# Altium schematic sheet MotorDriverChannel.SchDoc
size A4; SheetNumber: 2; SheetTotal: 5
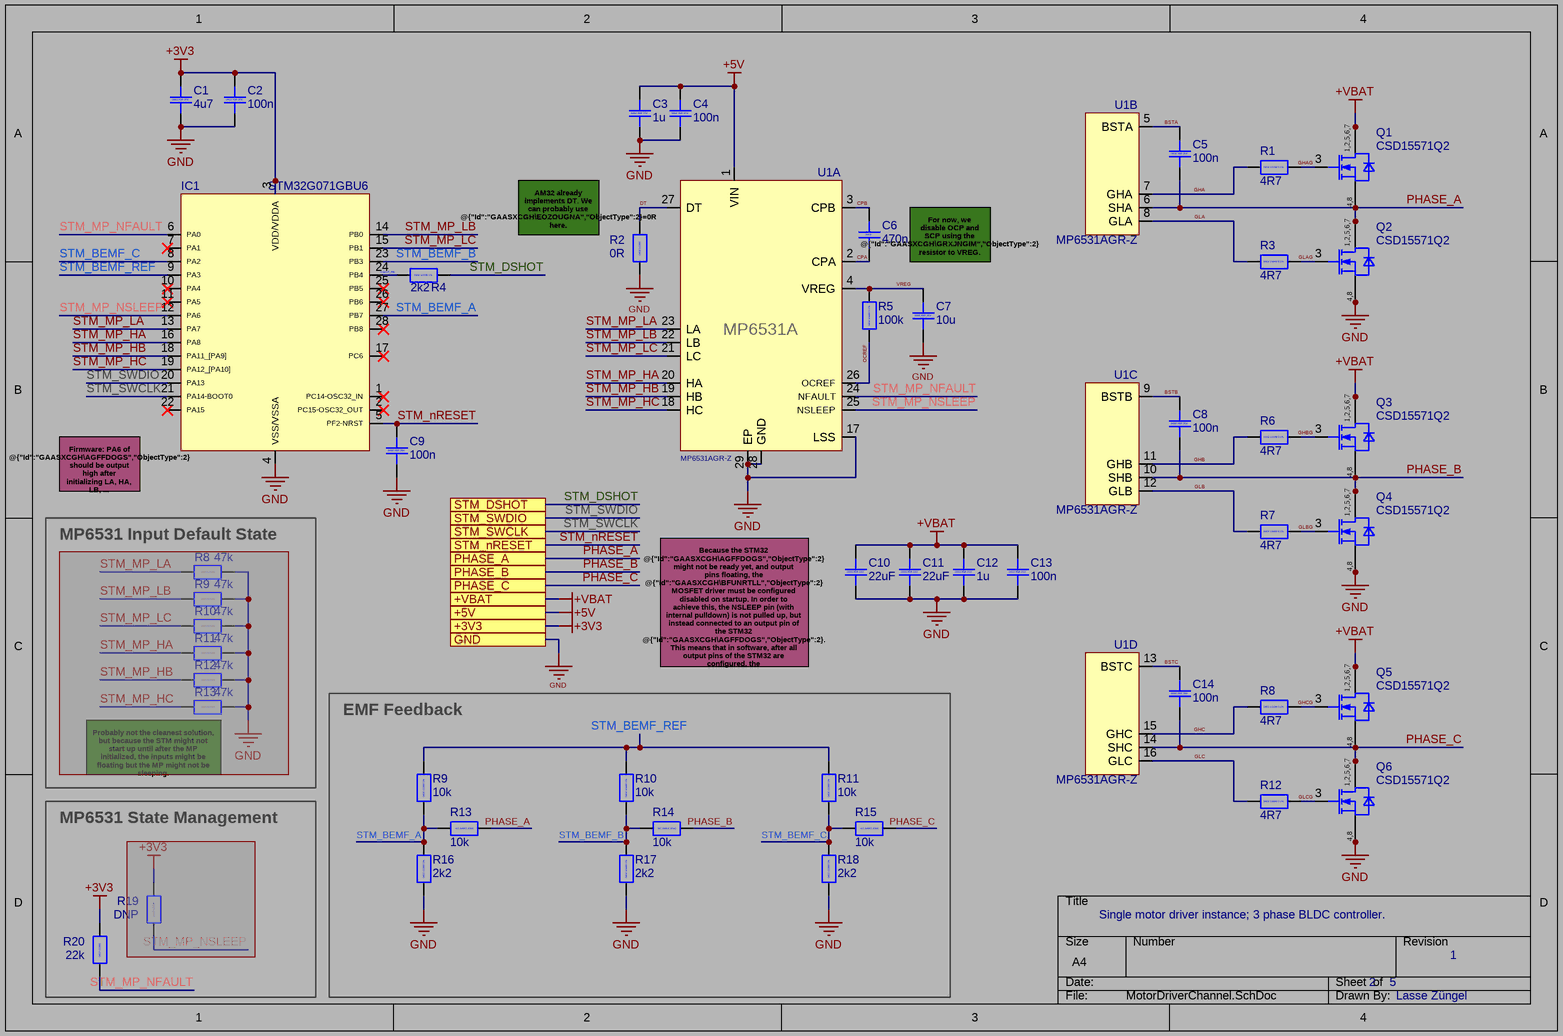
[diagram p0: MotorDriverChannel.SchDoc]

## Parts
(Parts that share a designator on the sheet are numbered #1, #2 ... from top to bottom, then left to right.)
C1  4u7  [CAP_0603_L]
C2  100n  [CAP_0402]
C3  1u  [CAP_0402]
C4  100n  [CAP_0402]
C5  100n  [CAP_0402]
C6  470n  [CAP_0402]
C7  10u  [CAP_0805s]
C8  100n  [CAP_0402]
C9  100n  [CAP_0402]
C10  22uF  [CAP_0805s]
C11  22uF  [CAP_0805s]
C12  1u  [CAP_0603_L]
C13  100n  [CAP_0402]
C14  100n  [CAP_0402]
IC1  STM32G071GBU6  [UFQFN28-STM32]
Q1  CSD15571Q2  [CSD15571Q2]
Q2  CSD15571Q2  [CSD15571Q2]
Q3  CSD15571Q2  [CSD15571Q2]
Q4  CSD15571Q2  [CSD15571Q2]
Q5  CSD15571Q2  [CSD15571Q2]
Q6  CSD15571Q2  [CSD15571Q2]
R1  4R7  [RES_0402]
R2  0R  [RES_0402]
R3  4R7  [RES_0402]
R4  2k2  [RES_0402]
R5  100k  [RES_0402]
R6  4R7  [RES_0402]
R7  4R7  [RES_0402]
R8#1  47k  [RES_0402]  (masked out: inside a compile mask, not in the netlist)
R8#2  4R7  [RES_0402]
R9#1  47k  [RES_0402]  (masked out: inside a compile mask, not in the netlist)
R9#2  10k  [RES_0402]
R10#1  47k  [RES_0402]  (masked out: inside a compile mask, not in the netlist)
R10#2  10k  [RES_0402]
R11#1  47k  [RES_0402]  (masked out: inside a compile mask, not in the netlist)
R11#2  10k  [RES_0402]
R12#1  47k  [RES_0402]  (masked out: inside a compile mask, not in the netlist)
R12#2  4R7  [RES_0402]
R13#1  47k  [RES_0402]  (masked out: inside a compile mask, not in the netlist)
R13#2  10k  [RES_0402]
R14  10k  [RES_0402]
R15  10k  [RES_0402]
R16  2k2  [RES_0402]
R17  2k2  [RES_0402]
R18  2k2  [RES_0402]
R19  DNP  [RES_0402]  (masked out: inside a compile mask, not in the netlist)
R20  22k  [RES_0402]
U1  MP6531AGR-Z  [MP6531A-QFN40P400X400X100-29N]  (parts A,B,C,D of 4)

## Blocks framed on the sheet
MP6531 Input Default State: R8#1 R9#1 R10#1 R11#1 R12#1 R13#1
EMF Feedback: R9#2 R10#2 R11#2 R13#2 R14-R18
MP6531 State Management: R19 R20

## Ports
+3V3 (see Main[2B], Interfacing[1A], Power[1B]), +5V (see Main[2B], Interfacing[1A], Power[1B]), +VBAT (see Main[2B], Interfacing[2B], Power[1B]), GND (see Main[2C], Interfacing[1A], Power[1B]), PHASE_A (see Main[2C], MotorConnection[1A]), PHASE_B (see Main[2C], MotorConnection[1A]), PHASE_C (see Main[2C], MotorConnection[1A]), STM_DSHOT (see Main[2C]), STM_nRESET (see Main[2C]), STM_SWCLK (see Main[2C]), STM_SWDIO (see Main[2C])

## Nets
+3V3: C1.2 C2.2 IC1.3(VDD/VDDA) R20.2 ; port +3V3
+5V: C3.2 C4.2 U1.1(VIN) ; port +5V
+VBAT: C10.2 C11.2 C12.2 C13.2 Q1.1(D_1) Q1.2(D_2) Q1.5(D_3) Q1.6(D_4) Q1.7(D_5) Q3.1(D_1) Q3.2(D_2) Q3.5(D_3) Q3.6(D_4) Q3.7(D_5) Q5.1(D_1) Q5.2(D_2) Q5.5(D_3) Q5.6(D_4) Q5.7(D_5) ; port +VBAT
GND: C1.1 C2.1 C3.1 C4.1 C7.1 C9.1 C10.1 C11.1 C12.1 C13.1 IC1.4(VSS/VSSA) Q2.4(S_1) Q2.8(S_2) Q4.4(S_1) Q4.8(S_2) Q6.4(S_1) Q6.8(S_2) R2.1 R16.1 R17.1 R18.1 U1.17(LSS) U1.28(GND) U1.29(EP) ; port GND
BSTA: C5.2 U1.5(BSTA)
BSTB: C8.2 U1.9(BSTB)
BSTC: C14.2 U1.13(BSTC)
CPA: C6.1 U1.2(CPA)
CPB: C6.2 U1.3(CPB)
DSHOT_PIN: IC1.24(PB4) R4.1
DT: R2.2 U1.27(DT)
GHA: R1.1 U1.7(GHA)
GHAG: Q1.3(G) R1.2
GHB: R6.1 U1.11(GHB)
GHBG: Q3.3(G) R6.2
GHC: R8#2.1 U1.15(GHC)
GHCG: Q5.3(G) R8#2.2
GLA: R3.1 U1.8(GLA)
GLAG: Q2.3(G) R3.2
GLB: R7.1 U1.12(GLB)
GLBG: Q4.3(G) R7.2
GLC: R12#2.1 U1.16(GLC)
GLCG: Q6.3(G) R12#2.2
OCREF: R5.1 U1.26(OCREF)
PHASE_A: C5.1 Q1.4(S_1) Q1.8(S_2) Q2.1(D_1) Q2.2(D_2) Q2.5(D_3) Q2.6(D_4) Q2.7(D_5) R13#2.1 U1.6(SHA) ; port PHASE_A
PHASE_B: C8.1 Q3.4(S_1) Q3.8(S_2) Q4.1(D_1) Q4.2(D_2) Q4.5(D_3) Q4.6(D_4) Q4.7(D_5) R14.1 U1.10(SHB) ; port PHASE_B
PHASE_C: C14.1 Q5.4(S_1) Q5.8(S_2) Q6.1(D_1) Q6.2(D_2) Q6.5(D_3) Q6.6(D_4) Q6.7(D_5) R15.1 U1.14(SHC) ; port PHASE_C
STM_BEMF_A: IC1.27(PB7) R9#2.1 R13#2.2 R16.2
STM_BEMF_B: IC1.23(PB3) R10#2.1 R14.2 R17.2
STM_BEMF_C: IC1.8(PA2) R11#2.1 R15.2 R18.2
STM_BEMF_REF: IC1.9(PA3) R9#2.2 R10#2.2 R11#2.2
STM_DSHOT: R4.2 ; port STM_DSHOT
STM_MP_HA: IC1.16(PA8) U1.20(HA)
STM_MP_HB: IC1.18(PA11_[PA9]) U1.19(HB)
STM_MP_HC: IC1.19(PA12_[PA10]) U1.18(HC)
STM_MP_LA: IC1.13(PA7) U1.23(LA)
STM_MP_LB: IC1.14(PB0) U1.22(LB)
STM_MP_LC: IC1.15(PB1) U1.21(LC)
STM_MP_NFAULT: IC1.6(PA0) R20.1 U1.24(NFAULT)
STM_MP_NSLEEP: IC1.12(PA6) U1.25(NSLEEP)
STM_nRESET: C9.2 IC1.5(PF2-NRST) ; port STM_nRESET
STM_SWCLK: IC1.21(PA14-BOOT0) ; port STM_SWCLK
STM_SWDIO: IC1.20(PA13) ; port STM_SWDIO
VREG: C7.2 R5.2 U1.4(VREG)

Not connected (* = marked no-connect by the designer): IC1 1(PC14-OSC32_IN)* 2(PC15-OSC32_OUT)* 7(PA1)* 10(PA4)* 11(PA5)* 17(PC6)* 22(PA15)* 25(PB5)* 26(PB6)* 28(PB8)*

## Notes on the sheet
- (near R2) AM32 already implements DT. We can probably use @{"Id":"GAASXCGH\EOZOUGNA","ObjectType":2}=0R here.
- For now, we disable OCP and SCP using the @{"Id":"GAASXCGH\GRXJNGIM","ObjectType":2} resistor to VREG.
- (near IC1) Firmware: PA6 of @{"Id":"GAASXCGH\AGFFDOGS","ObjectType":2} should be output high after initializing LA, HA, LB, ...
- (near C10) Because the STM32 @{"Id":"GAASXCGH\AGFFDOGS","ObjectType":2} might not be ready yet, and output pins floating, the @{"Id":"GAASXCGH\BFUNRTLL","ObjectType":2} MOSFET driver must be configured disabled on startup. In order to achieve this, the NSLEEP pin (with internal pulldown) is not pulled up, but instead connected to an output pin of the STM32 @{"Id":"GAASXCGH\AGFFDOGS","ObjectType":2}. This means that in software, after all output pins of the STM32 are configured, the @{"Id":"GAASXCGH\RPXEHWLX","ObjectType":1} pin should be driven high to enable the MOSFET driver.
- (near R13#1) Probably not the cleanest solution, but because the STM might not start up until after the MP initialized, the inputs might be floating but the MP might not be sleeping.
  This way, we don't have to touch the AM32 firmware.
- Single motor driver instance; 3 phase BLDC controller.
- 2    5
- 1
- Lasse Züngel
- (in symbol AC0402FR-7D2K2L) 0402 1/16W 1%
- (in symbol AE0402BR-07100KL) 0402 1/16W 0.1%
- (in symbol CAP_0402) 0402
- (in symbol CAP_0402_X5R_25V) 0402 X5R 25V
- (in symbol CAP_0603_X5R_25V) 0603 X5R 25V
- (in symbol CSD15571Q2) 1,2,5,6,7; 4,8
- (in symbol GXT21BR61C226ME13L) 0805 X5R 16V
- (in symbol MCAST21GBB5106KTNA01) 0805 X5R 25V
- (in symbol MP6531AGR-Z, part A) MP6531A
- (in symbol RC0402FR-7W4R7L) 0402 1/16W 0.1%
- (in symbol RES_0402) 0402 1/16W
- (in symbol RES_0402_1PERCENT) 0402 1/16W 1%

## Library data of the parts
C1 C12 = CAP_0603_X5R_25V: Capacitor 0603 generic, X5R, 25V
C2-C5 C8 C9 C13 C14 = CAP_0402_X5R_25V: Capacitor 0402 generic, X5R, 25V
C6 = CAP_0402: Capacitor 0402 generic
C7 = MCAST21GBB5106KTNA01: Multilayer Ceramic Capacitors MLCC - SMD/SMT 25V 10uF X5R 0805 10%; Manufacturer_Name: TAIYO YUDEN; Datasheet Link: https://www.mouser.com/catalog/specsheets/Taiyo%20Yuden_1102023_MC_mlcc_all_e.pdf; Manufacturer_Part_Number: MCAST21GBB5106KTNA01
C10 C11 = GXT21BR61C226ME13L: Multilayer Ceramic Capacitors MLCC - SMD/SMT 0805 16VDC 22uF 20% X5R AEC-Q200; Manufacturer_Name: Murata Electronics; Datasheet Link: https://www.mouser.de/datasheet/3/76/4/GXT21BR61C226ME13_01A.pdf; Manufacturer_Part_Number: GXT21BR61C226ME13L
IC1 = STM32G071GBU6: Integrated Circuit; Manufacturer_Name: STMicroelectronics; Datasheet Link: https://www.st.com/resource/en/datasheet/stm32g071c8.pdf; Height: 0.6mm; Manufacturer_Part_Number: STM32G071GBU6; Mouser Part Number: 511-STM32G071GBU6; Mouser Price/Stock: https://www.mouser.co.uk/ProductDetail/STMicroelectronics/STM32G071GBU6?qs=PqoDHHvF64%2FgmAx6dD98Vg%3D%3D; Arrow Part Number: STM32G071GBU6; Arrow Price/Stock: https://www.arrow.com/en/products/stm32g071gbu6/stmicroelectronics?region=nac
Q1-Q6 = CSD15571Q2: MOSFET 20V N-Channel NexFET Pwr MOSFET; Manufacturer_Name: Texas Instruments; Datasheet Link: http://www.ti.com/lit/gpn/csd15571q2; Height: 0.8mm; Manufacturer_Part_Number: CSD15571Q2; Mouser Part Number: 595-CSD15571Q2; Mouser Price/Stock: https://www.mouser.co.uk/ProductDetail/Texas-Instruments/CSD15571Q2?qs=OGNXFUZBARuNT0xCwaBM7Q%3D%3D; Arrow Part Number: CSD15571Q2; Arrow Price/Stock: https://www.arrow.com/en/products/csd15571q2/texas-instruments
R1 R3 R6 R7 R8#2 R12#2 = RC0402FR-7W4R7L: Thick Film Resistors - SMD General Purpose Chip Resistor 0402, 4.7Ohms, 1%, 1/16W; Manufacturer_Name: YAGEO; Manufacturer_Part_Number: RC0402FR-7W4R7L
R2 R8#1 R9#1 R10#1 R11#1 R12#1 R13#1 R19 R20 = RES_0402: Resistor 0402 generic, 1/16W
R4 R16-R18 = AC0402FR-7D2K2L: Thick Film Resistors - SMD 2.2 kOhms 1/16 W 50 V 1 % 0402 100 PPM / C - 55 C / + 155 C AEC-Q200; Manufacturer_Name: YAGEO; Manufacturer_Part_Number: AC0402FR-7D2K2L
R5 = AE0402BR-07100KL: Thick Film Resistors - SMD 100KOhm 0402 1/3W 0.1% Hal Free AEC-Q200; Manufacturer_Name: YAGEO; Datasheet Link: https://yageogroup.com/content/datasheet/asset/file/PYU-AE_51_ROHS_L; Manufacturer_Part_Number: AE0402BR-07100KL
R9#2 R10#2 R11#2 R13#2 R14 R15 = RES_0402_1PERCENT: Resistor 0402 generic, 1/16W, 1%
U1 = MP6531AGR-Z: Integrated Circuit; Manufacturer_Name: Monolithic Power Systems (MPS); Datasheet Link: https://www.monolithicpower.com/en/documentview/productdocument/index/version/2/document_type/Datasheet/lang/en/sku/MP6531A/document_id/1862/; Height: 1mm; Manufacturer_Part_Number: MP6531AGR-Z; Mouser Part Number: 946-MP6531AGR-Z; Mouser Price/Stock: https://www.mouser.co.uk/ProductDetail/Monolithic-Power-Systems-MPS/MP6531AGR-Z?qs=5aG0NVq1C4xl7PDY2hKmEA%3D%3D